# Altium schematic sheet MotorBoardSchematic.SchDoc
size A4
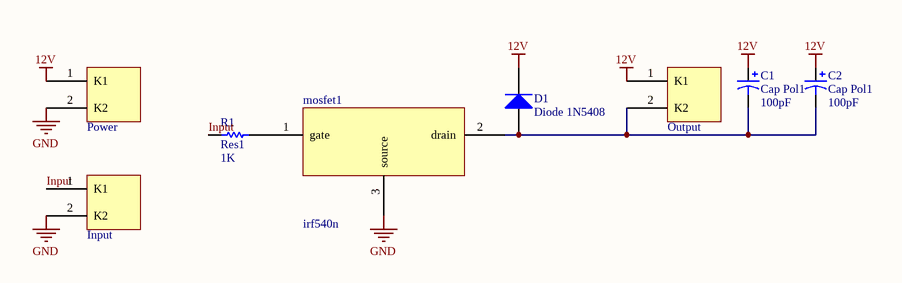
[diagram p0: MotorBoardSchematic.SchDoc]

## Parts
C1  Cap Pol1  value 100pF  [Electrolytic_Capacitor]
C2  Cap Pol1  value 100pF  [Electrolytic_Capacitor]
D1  Diode 1N5408  [DO-201AD]
Input  Klema  [Klema]  (value not drawn)
mosfet1  irf540n  [TO220]
Output  Klema  [Klema]  (value not drawn)
Power  Klema  [Klema]  (value not drawn)
R1  Res1  value 1K  [AXIAL-0.3]

## Nets
12V: C1.1 C2.1 D1.2(K) Output.1(K1) Power.1(K1)
GND: Input.2(K2) mosfet1.3(source) Power.2(K2)
Input: Input.1(K1) R1.1
NetC1_2: C1.2 C2.2 D1.1(A) mosfet1.2(drain) Output.2(K2)
Netmosfet1_1: mosfet1.1(gate) R1.2

## Library data of the parts
C1 C2 = Cap Pol1: Polarized Capacitor (Radial); Published: 8-Jun-2000; LatestRevisionDate: 17-Jul-2002; LatestRevisionNote: Re-released for DXP Platform.; PackageReference: RB7.6-15; Publisher: Altium Limited; PackageDescription: Polarized Capacitor (Radial); 2 Leads
D1 = Diode 1N5408: 3 Amp Medium Power Silicon Rectifier Diode; Published: 8-Jun-2000; LatestRevisionDate: 17-Jul-2002; LatestRevisionNote: Re-released for DXP Platform.; DatasheetVersion: Aug-1984; PackageReference: DO-201AD; Publisher: Altium Limited; PackageDescription: Diode, Axial; Body 9.5 x 5.3 mm (LxDia. max), Lead Dia. 1.32 mm (max); ComponentLink1Description: Manufacturer Link; ComponentLink1URL: http://www.irf.com/
R1 = Res1: Resistor; Published: 8-Jun-2000; LatestRevisionDate: 17-Jul-2002; LatestRevisionNote: Re-released for DXP Platform.; PackageReference: AXIAL-0.3; Publisher: Altium Limited; PackageDescription: Axial Device, Thru-Hole; 2 Leads; 0.3 in Pin Spacing